# Altium schematic sheet peripherals.SchDoc (part 1 of 4)
size A2; SheetNumber: 3; SheetTotal: 4
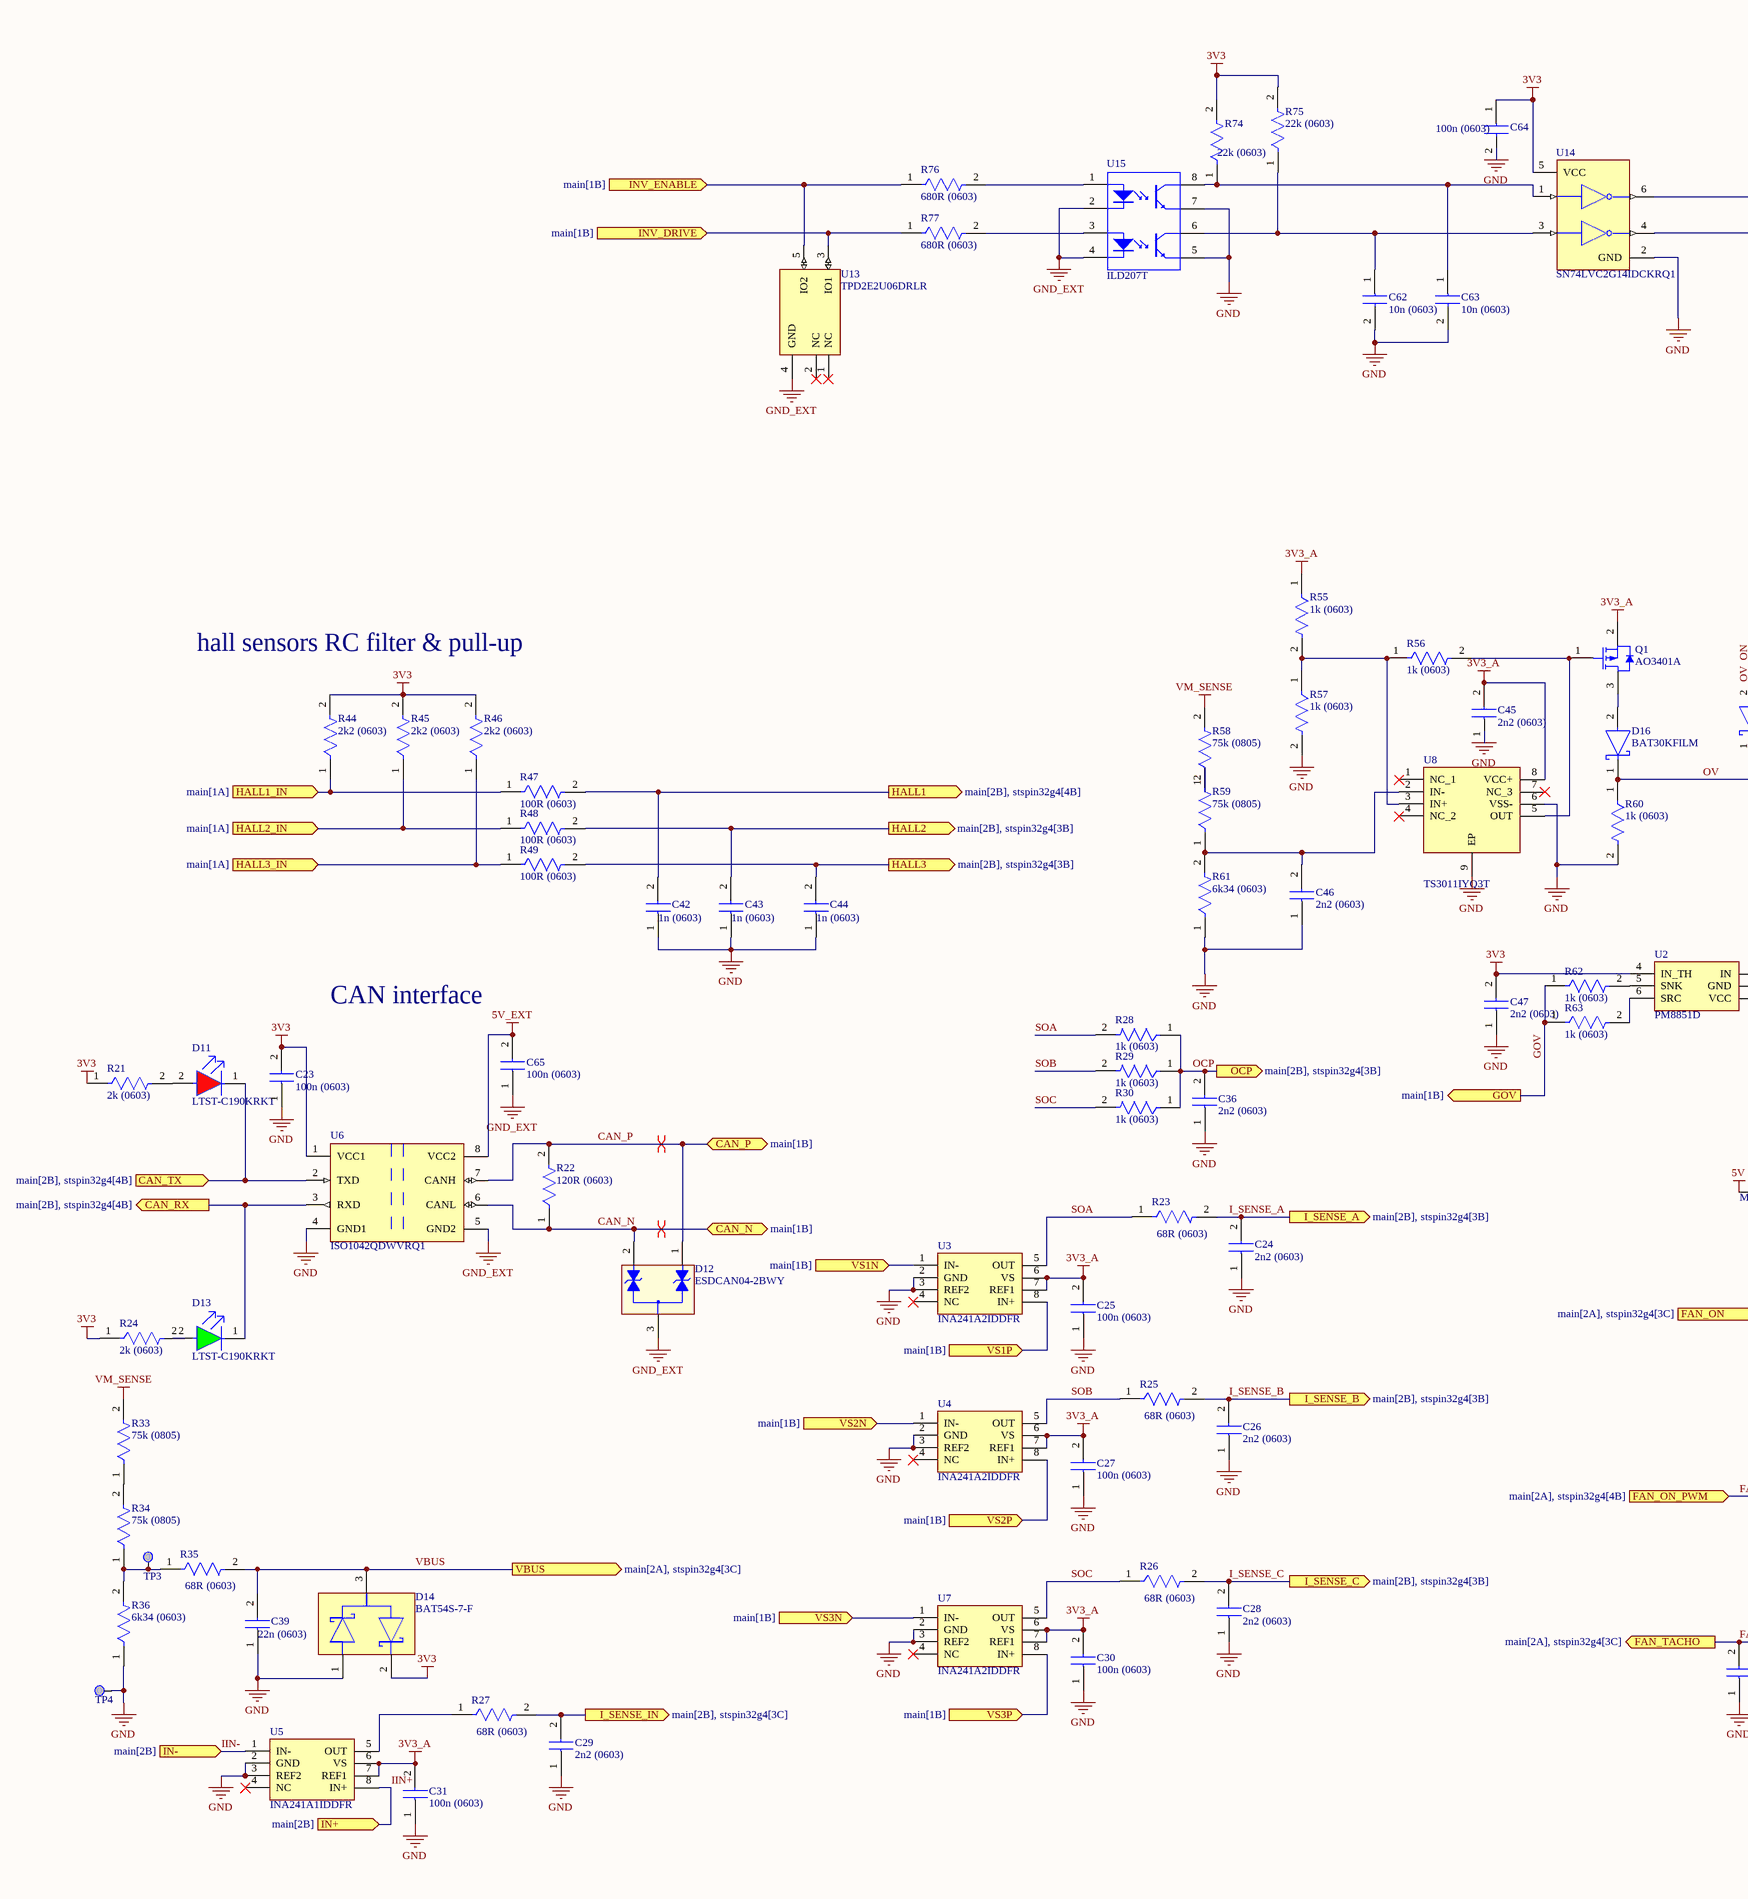
[diagram p0: peripherals.SchDoc, left]
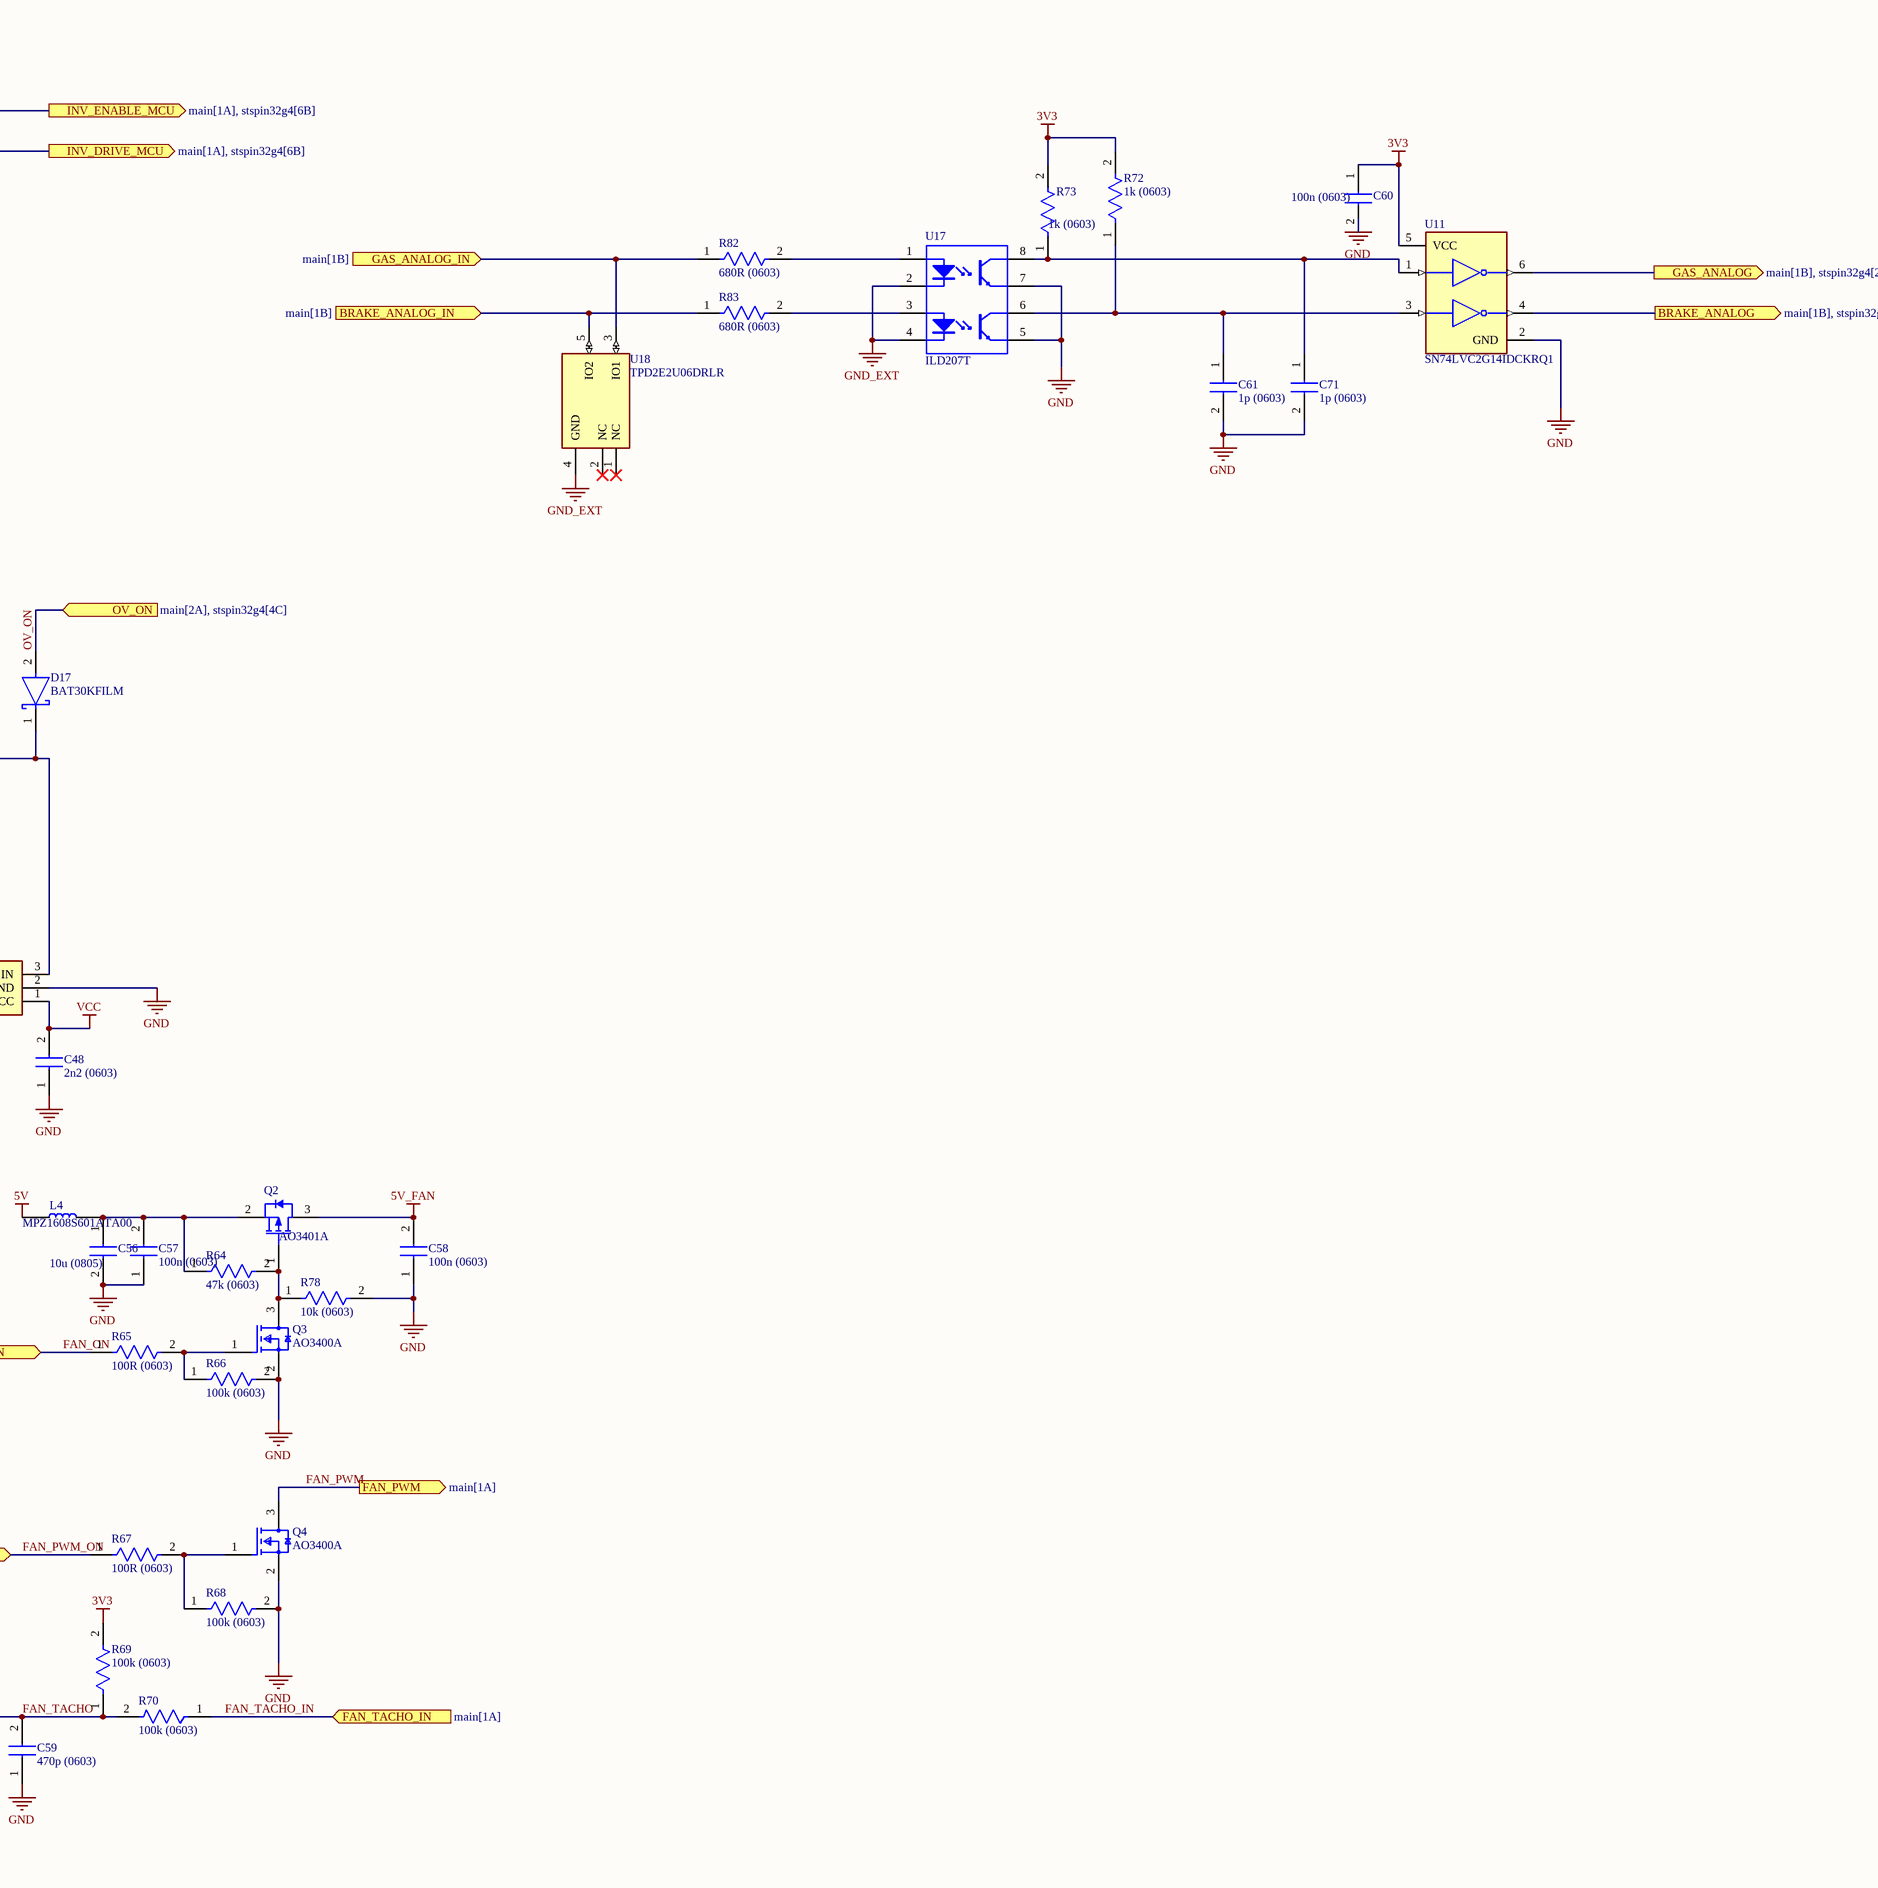
[diagram p1: peripherals.SchDoc, right]

## Parts
C23  100n (0603)  [C0603]
C24  2n2 (0603)  [C0603]
C25  100n (0603)  [C0603]
C26  2n2 (0603)  [C0603]
C27  100n (0603)  [C0603]
C28  2n2 (0603)  [C0603]
C29  2n2 (0603)  [C0603]
C30  100n (0603)  [C0603]
C31  100n (0603)  [C0603]
C36  2n2 (0603)  [C0603]
C39  22n (0603)  [C0603]
C42  1n (0603)  [C0603]
C43  1n (0603)  [C0603]
C44  1n (0603)  [C0603]
C45  2n2 (0603)  [C0603]
C46  2n2 (0603)  [C0603]
C47  2n2 (0603)  [C0603]
C48  2n2 (0603)  [C0603]
C56  10u (0805)  [C0805]
C57  100n (0603)  [C0603]
C58  100n (0603)  [C0603]
C59  470p (0603)  [C0603]
C60  100n (0603)  [C0603]
C61  1p (0603)  [C0603]
C62  10n (0603)  [C0603]
C63  10n (0603)  [C0603]
C64  100n (0603)  [C0603]
C65  100n (0603)  [C0603]
C71  1p (0603)  [C0603]
D11  LTST-C190KRKT  [FP-LTST-C190KRKT-MFG]
D12  ESDCAN04-2BWY  [SOT65P210X110-3N]
D13  LTST-C190KRKT  [FP-LTST-C190KRKT-MFG]
D14  BAT54S-7-F  [FP-SOT23-MFG]
D16  BAT30KFILM  [FP-SOD-523-IPC_C]
D17  BAT30KFILM  [FP-SOD-523-IPC_C]
L4  MPZ1608S601ATA00  [INDC1608X95N]
Q1  AO3401A  [AO-SOT-23-3L_V]
Q2  AO3401A  [AO-SOT-23-3L_V]
Q3  AO3400A  [FP-SOT23-MFG]
Q4  AO3400A  [FP-SOT23-MFG]
R21  2k (0603)  [R0603]
R22  120R (0603)  [R0603]
R23  68R (0603)  [R0603]
R24  2k (0603)  [R0603]
R25  68R (0603)  [R0603]
R26  68R (0603)  [R0603]
R27  68R (0603)  [R0603]
R28  1k (0603)  [R0603]
R29  1k (0603)  [R0603]
R30  1k (0603)  [R0603]
R33  75k (0805)  [R0805]
R34  75k (0805)  [R0805]
R35  68R (0603)  [R0603]
R36  6k34 (0603)  [R0603]
R44  2k2 (0603)  [R0603]
R45  2k2 (0603)  [R0603]
R46  2k2 (0603)  [R0603]
R47  100R (0603)  [R0603]
R48  100R (0603)  [R0603]
R49  100R (0603)  [R0603]
R55  1k (0603)  [R0603]
R56  1k (0603)  [R0603]
R57  1k (0603)  [R0603]
R58  75k (0805)  [R0805]
R59  75k (0805)  [R0805]
R60  1k (0603)  [R0603]
R61  6k34 (0603)  [R0603]
R62  1k (0603)  [R0603]
R63  1k (0603)  [R0603]
R64  47k (0603)  [R0603]
R65  100R (0603)  [R0603]
R66  100k (0603)  [R0603]
R67  100R (0603)  [R0603]
R68  100k (0603)  [R0603]
R69  100k (0603)  [R0603]
R70  100k (0603)  [R0603]
R72  1k (0603)  [R0603]
R73  1k (0603)  [R0603]
R74  22k (0603)  [R0603]
R75  22k (0603)  [R0603]
R76  680R (0603)  [R0603]
R77  680R (0603)  [R0603]
R78  10k (0603)  [R0603]
R82  680R (0603)  [R0603]
R83  680R (0603)  [R0603]
TP3  TP  [Test_Point_45]  (value not drawn)
TP4  TP  [Test_Point_50]  (value not drawn)
U2  PM8851D  [SOT95P280X145-6N]
U3  INA241A2IDDFR  [SOT65P280X110-8N]
U4  INA241A2IDDFR  [SOT65P280X110-8N]
U5  INA241A1IDDFR  [SOT65P280X110-8N]
U6  ISO1042QDWVRQ1  [FP-DWV0008A-IPC_C]
U7  INA241A2IDDFR  [SOT65P280X110-8N]
U8  TS3011IYQ3T  [SON50P200X200X80-9N]
U11  SN74LVC2G14IDCKRQ1  [FP-DCK0006A-IPC_C]
U13  TPD2E2U06DRLR  [FP-DRL0005A-MFG]
U14  SN74LVC2G14IDCKRQ1  [FP-DCK0006A-IPC_C]
U15  ILD207T  [VISH-SOIC-8_C_V]
U17  ILD207T  [VISH-SOIC-8_C_V]
U18  TPD2E2U06DRLR  [FP-DRL0005A-MFG]

## Ports
BRAKE_ANALOG (out, see main[1B], stspin32g4[3C]), BRAKE_ANALOG_IN (in, see main[1B]), CAN_N (bidir, see main[1B]), CAN_P (bidir, see main[1B]), CAN_RX (out, see main[2B], stspin32g4[4B]), CAN_TX (in, see main[2B], stspin32g4[4B]), FAN_ON (in, see main[2A], stspin32g4[3C]), FAN_ON_PWM (in, see main[2A], stspin32g4[4B]), FAN_PWM (out, see main[1A]), FAN_TACHO (out, see main[2A], stspin32g4[3C]), FAN_TACHO_IN (in, see main[1A]), GAS_ANALOG (out, see main[1B], stspin32g4[2C]), GAS_ANALOG_IN (in, see main[1B]), GOV (out, see main[1B]), HALL1 (out, see main[2B], stspin32g4[4B]), HALL1_IN (in, see main[1A]), HALL2 (out, see main[2B], stspin32g4[3B]), HALL2_IN (in, see main[1A]), HALL3 (out, see main[2B], stspin32g4[3B]), HALL3_IN (in, see main[1A]), I_SENSE_A (out, see main[2B], stspin32g4[3B]), I_SENSE_B (out, see main[2B], stspin32g4[3B]), I_SENSE_C (out, see main[2B], stspin32g4[3B]), I_SENSE_IN (out, see main[2B], stspin32g4[3C]), IN+ (in, see main[2B]), IN- (in, see main[2B]), INV_DRIVE (in, see main[1B]), INV_DRIVE_MCU (out, see main[1A], stspin32g4[6B]), INV_ENABLE (in, see main[1B]), INV_ENABLE_MCU (out, see main[1A], stspin32g4[6B]), OCP (out, see main[2B], stspin32g4[3B]), OV_ON (in, see main[2A], stspin32g4[4C]), VBUS (out, see main[2A], stspin32g4[3C]), VS1N (in, see main[1B]), VS1P (in, see main[1B]), VS2N (in, see main[1B]), VS2P (in, see main[1B]), VS3N (in, see main[1B]), VS3P (in, see main[1B])

## Nets
3V3: C23.2 C47.2 C60.1 C64.1 D14.2 R21.1 R24.1 R44.2 R45.2 R46.2 R69.2 R72.2 R73.2 R74.2 R75.2 U2.4(IN_TH) U6.1(VCC1) U11.5(VCC) U14.5(VCC)
3V3_A: C25.2 C27.2 C30.2 C31.2 C45.2 Q1.2(SOURCE) R55.1 U3.6(VS) U3.7(REF1) U4.6(VS) U4.7(REF1) U5.6(VS) U5.7(REF1) U7.6(VS) U7.7(REF1) U8.8(VCC+)
5V: L4.1
5V_EXT: C65.2 U6.8(VCC2)
5V_FAN: C58.2 Q2.3(DRAIN)
GND: C23.1 C24.1 C25.1 C26.1 C27.1 C28.1 C29.1 C30.1 C31.1 C36.1 C39.1 C42.1 C43.1 C44.1 C45.1 C46.1 C47.1 C48.1 C56.2 C57.1 C58.1 C59.1 C60.2 C61.2 C62.2 C63.2 C64.2 C71.2 D14.1 Q3.2(S) Q4.2(S) R36.1 R57.2 R60.2 R61.1 R66.2 R68.2 R78.2 TP4.1 U2.2(GND) U3.2(GND) U3.3(REF2) U4.2(GND) U4.3(REF2) U5.2(GND) U5.3(REF2) U6.4(GND1) U7.2(GND) U7.3(REF2) U8.6(VSS-) U8.9(EP) U11.2(GND) U14.2(GND) U15.5(E) U15.7(E) U17.5(E) U17.7(E)
GND_EXT: C65.1 D12.3 U6.5(GND2) U13.4(GND) U15.2(K) U15.4(K) U17.2(K) U17.4(K) U18.4(GND)
VCC: C48.2 U2.1(VCC)
VM_SENSE: R33.2 R58.2
BRAKE_ANALOG: U11.4(2Y) ; port BRAKE_ANALOG
BRAKE_ANALOG_IN: R83.1 U18.5(IO2) ; port BRAKE_ANALOG_IN
CAN_N: D12.2 R22.1 U6.6(CANL) ; port CAN_N
CAN_P: D12.1 R22.2 U6.7(CANH) ; port CAN_P
CAN_RX: D13.1(C) U6.3(RXD) ; port CAN_RX
CAN_TX: D11.1(C) U6.2(TXD) ; port CAN_TX
FAN_ON: R65.1 ; port FAN_ON
FAN_PWM: Q4.3(D) ; port FAN_PWM
FAN_PWM_ON: R67.1 ; port FAN_ON_PWM
FAN_TACHO: C59.2 R69.1 R70.2 ; port FAN_TACHO
FAN_TACHO_IN: R70.1 ; port FAN_TACHO_IN
GAS_ANALOG: U11.6(1Y) ; port GAS_ANALOG
GAS_ANALOG_IN: R82.1 U18.3(IO1) ; port GAS_ANALOG_IN
GOV: R62.1 R63.1 ; port GOV
HALL1: C42.2 R47.2 ; port HALL1
HALL1_IN: R44.1 R47.1 ; port HALL1_IN
HALL2: C43.2 R48.2 ; port HALL2
HALL2_IN: R45.1 R48.1 ; port HALL2_IN
HALL3: C44.2 R49.2 ; port HALL3
HALL3_IN: R46.1 R49.1 ; port HALL3_IN
I_SENSE_A: C24.2 R23.2 ; port I_SENSE_A
I_SENSE_B: C26.2 R25.2 ; port I_SENSE_B
I_SENSE_C: C28.2 R26.2 ; port I_SENSE_C
I_SENSE_IN: C29.2 R27.2 ; port I_SENSE_IN
IIN+: U5.8(IN+) ; port IN+
IIN-: U5.1(IN-) ; port IN-
INV_DRIVE: R77.1 U13.3(IO1) ; port INV_DRIVE
INV_DRIVE_MCU: U14.4(2Y) ; port INV_DRIVE_MCU
INV_ENABLE: R76.1 U13.5(IO2) ; port INV_ENABLE
INV_ENABLE_MCU: U14.6(1Y) ; port INV_ENABLE_MCU
OCP: C36.2 R28.1 R29.1 R30.1 ; port OCP
OV: D16.1(C) D17.1(C) R60.1 U2.3(IN)
OV_ON: D17.2(A) ; port OV_ON
SOA: R23.1 R28.2 U3.5(OUT)
SOB: R25.1 R29.2 U4.5(OUT)
SOC: R26.1 R30.2 U7.5(OUT)
VBUS: C39.2 D14.3 R35.2 ; port VBUS
VS1N: U3.1(IN-) ; port VS1N
VS1P: U3.8(IN+) ; port VS1P
VS2N: U4.1(IN-) ; port VS2N
VS2P: U4.8(IN+) ; port VS2P
VS3N: U7.1(IN-) ; port VS3N
VS3P: U7.8(IN+) ; port VS3P
NetC46_2: C46.2 R59.1 R61.2 U8.2(IN-)
NetC56_1: C56.1 C57.2 L4.2 Q2.2(SOURCE) R64.1
NetC61_1: C61.1 R72.1 U11.3(2A) U17.6(C)
NetC62_1: C62.1 R75.1 U14.3(2A) U15.6(C)
NetC63_1: C63.1 R74.1 U14.1(1A) U15.8(C)
NetC71_1: C71.1 R73.1 U11.1(1A) U17.8(C)
NetD11_2: D11.2(A) R21.2
NetD13_2: D13.2(A) R24.2
NetD16_2: D16.2(A) Q1.3(DRAIN)
NetQ1_1: Q1.1(GATE) R56.2 U8.5(OUT)
NetQ2_1: Q2.1(GATE) Q3.3(D) R64.2 R78.1
NetQ3_1: Q3.1(G) R65.2 R66.1
NetQ4_1: Q4.1(G) R67.2 R68.1
NetR27_1: R27.1 U5.5(OUT)
NetR33_1: R33.1 R34.2
NetR34_1: R34.1 R35.1 R36.2 TP3.1
NetR55_2: R55.2 R56.1 R57.1 U8.3(IN+)
NetR58_1: R58.1 R59.2
NetR62_2: R62.2 U2.5(SNK)
NetR63_2: R63.2 U2.6(SRC)
NetR76_2: R76.2 U15.1(A)
NetR77_2: R77.2 U15.3(A)
NetR82_2: R82.2 U17.1(A)
NetR83_2: R83.2 U17.3(A)

Not connected (* = marked no-connect by the designer): U3 4(NC)*; U4 4(NC)*; U5 4(NC)*; U7 4(NC)*; U8 1(NC_1)* 4(NC_2)* 7(NC_3)*; U13 1(NC)* 2(NC)*; U18 1(NC)* 2(NC)*

## Layout directives
differential pair: CAN_N, CAN_P

## Notes on the sheet
- hall sensors RC filter & pull-up
- CAN interface